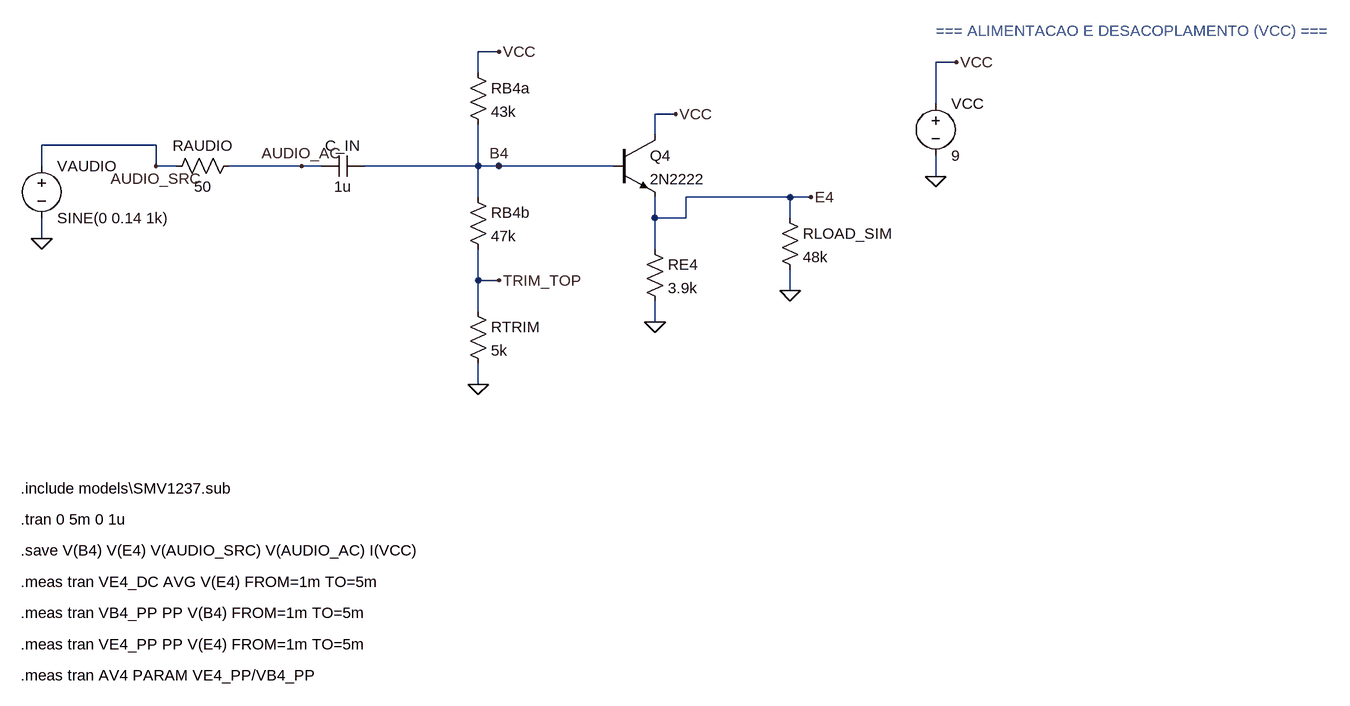
[diagram p0: schematic TESTE_bloco1_audio.asc]
TESTE_bloco1_audio.asc, the LTspice schematic file:
Version 4
SHEET 1 2592 1280
WIRE 96 368 96 400
WIRE 304 288 272 288
WIRE 384 288 416 288
WIRE 528 288 496 288
WIRE 592 288 624 288
WIRE 768 144 768 112
WIRE 768 112 800 112
WIRE 768 224 768 336
WIRE 768 288 800 288
WIRE 768 416 768 512
WIRE 768 464 800 464
WIRE 768 592 768 624
WIRE 976 288 944 288
WIRE 1040 240 1040 208
WIRE 1040 208 1072 208
WIRE 1040 336 1040 416
WIRE 1040 368 1088 368
WIRE 1040 496 1040 528
WIRE 1248 368 1248 336
WIRE 1248 336 1280 336
WIRE 1248 448 1248 480
WIRE 1472 192 1472 128
WIRE 1472 272 1472 304
WIRE 1472 128 1504 128
WIRE 96 288 96 256
WIRE 96 256 128 256
WIRE 416 288 496 288
WIRE 128 256 272 256
WIRE 272 256 272 288
WIRE 1088 368 1088 336
WIRE 1088 336 1280 336
WIRE 624 288 800 288
WIRE 800 288 944 288
FLAG 96 400 0
FLAG 272 288 AUDIO_SRC
FLAG 496 288 AUDIO_AC
FLAG 800 112 VCC
FLAG 800 288 B4
FLAG 800 464 TRIM_TOP
FLAG 768 624 0
FLAG 1072 208 VCC
FLAG 1040 528 0
FLAG 1280 336 E4
FLAG 1248 480 0
FLAG 1472 304 0
FLAG 1504 128 VCC
SYMBOL voltage 96 272 R0
WINDOW 3 24 96 Left 2
SYMATTR InstName VAUDIO
SYMATTR Value SINE(0 0.14 1k)
SYMBOL res 400 272 R90
WINDOW 0 0 56 VBottom 2
WINDOW 3 32 56 VTop 2
SYMATTR InstName RAUDIO
SYMATTR Value 50
SYMBOL cap 592 272 R90
WINDOW 0 0 32 VBottom 2
WINDOW 3 32 32 VTop 2
SYMATTR InstName C_IN
SYMATTR Value 1u
SYMBOL res 752 128 R0
SYMATTR InstName RB4a
SYMATTR Value 43k
SYMBOL res 752 320 R0
SYMATTR InstName RB4b
SYMATTR Value 47k
SYMBOL res 752 496 R0
SYMATTR InstName RTRIM
SYMATTR Value 5k
SYMBOL npn 976 240 R0
SYMATTR InstName Q4
SYMATTR Value 2N2222
SYMBOL res 1024 400 R0
SYMATTR InstName RE4
SYMATTR Value 3.9k
SYMBOL res 1232 352 R0
SYMATTR InstName RLOAD_SIM
SYMATTR Value 48k
SYMBOL voltage 1472 176 R0
WINDOW 3 24 96 Left 2
SYMATTR InstName VCC
SYMATTR Value 9
TEXT 1472 80 Left 2 ;=== ALIMENTACAO E DESACOPLAMENTO (VCC) ===
TEXT 64 784 Left 2 !.include models\SMV1237.sub
TEXT 64 832 Left 2 !.tran 0 5m 0 1u
TEXT 64 880 Left 2 !.save V(B4) V(E4) V(AUDIO_SRC) V(AUDIO_AC) I(VCC)
TEXT 64 928 Left 2 !.meas tran VE4_DC AVG V(E4) FROM=1m TO=5m
TEXT 64 976 Left 2 !.meas tran VB4_PP PP V(B4) FROM=1m TO=5m
TEXT 64 1024 Left 2 !.meas tran VE4_PP PP V(E4) FROM=1m TO=5m
TEXT 64 1072 Left 2 !.meas tran AV4 PARAM VE4_PP/VB4_PP

The netlist it stands for:
* TESTE_bloco1_audio.asc
VAUDIO AUDIO_SRC 0 SINE(0 0.14 1k)
RAUDIO AUDIO_AC AUDIO_SRC 50
C_IN B4 AUDIO_AC 1u
RB4a VCC B4 43k
RB4b B4 TRIM_TOP 47k
RTRIM TRIM_TOP 0 5k
Q4 VCC B4 E4 0 2N2222
RE4 E4 0 3.9k
RLOAD_SIM E4 0 48k
VCC VCC 0 9
.model NPN NPN
.model PNP PNP
.lib standard.bjt
* === ALIMENTACAO E DESACOPLAMENTO (VCC) ===
.include models\SMV1237.sub
.tran 0 5m 0 1u
.save V(B4) V(E4) V(AUDIO_SRC) V(AUDIO_AC) I(VCC)
.meas tran VE4_DC AVG V(E4) FROM=1m TO=5m
.meas tran VB4_PP PP V(B4) FROM=1m TO=5m
.meas tran VE4_PP PP V(E4) FROM=1m TO=5m
.meas tran AV4 PARAM VE4_PP/VB4_PP
.backanno
.end